# EAGLE design source_eagle (EAGLE 9.6.2)
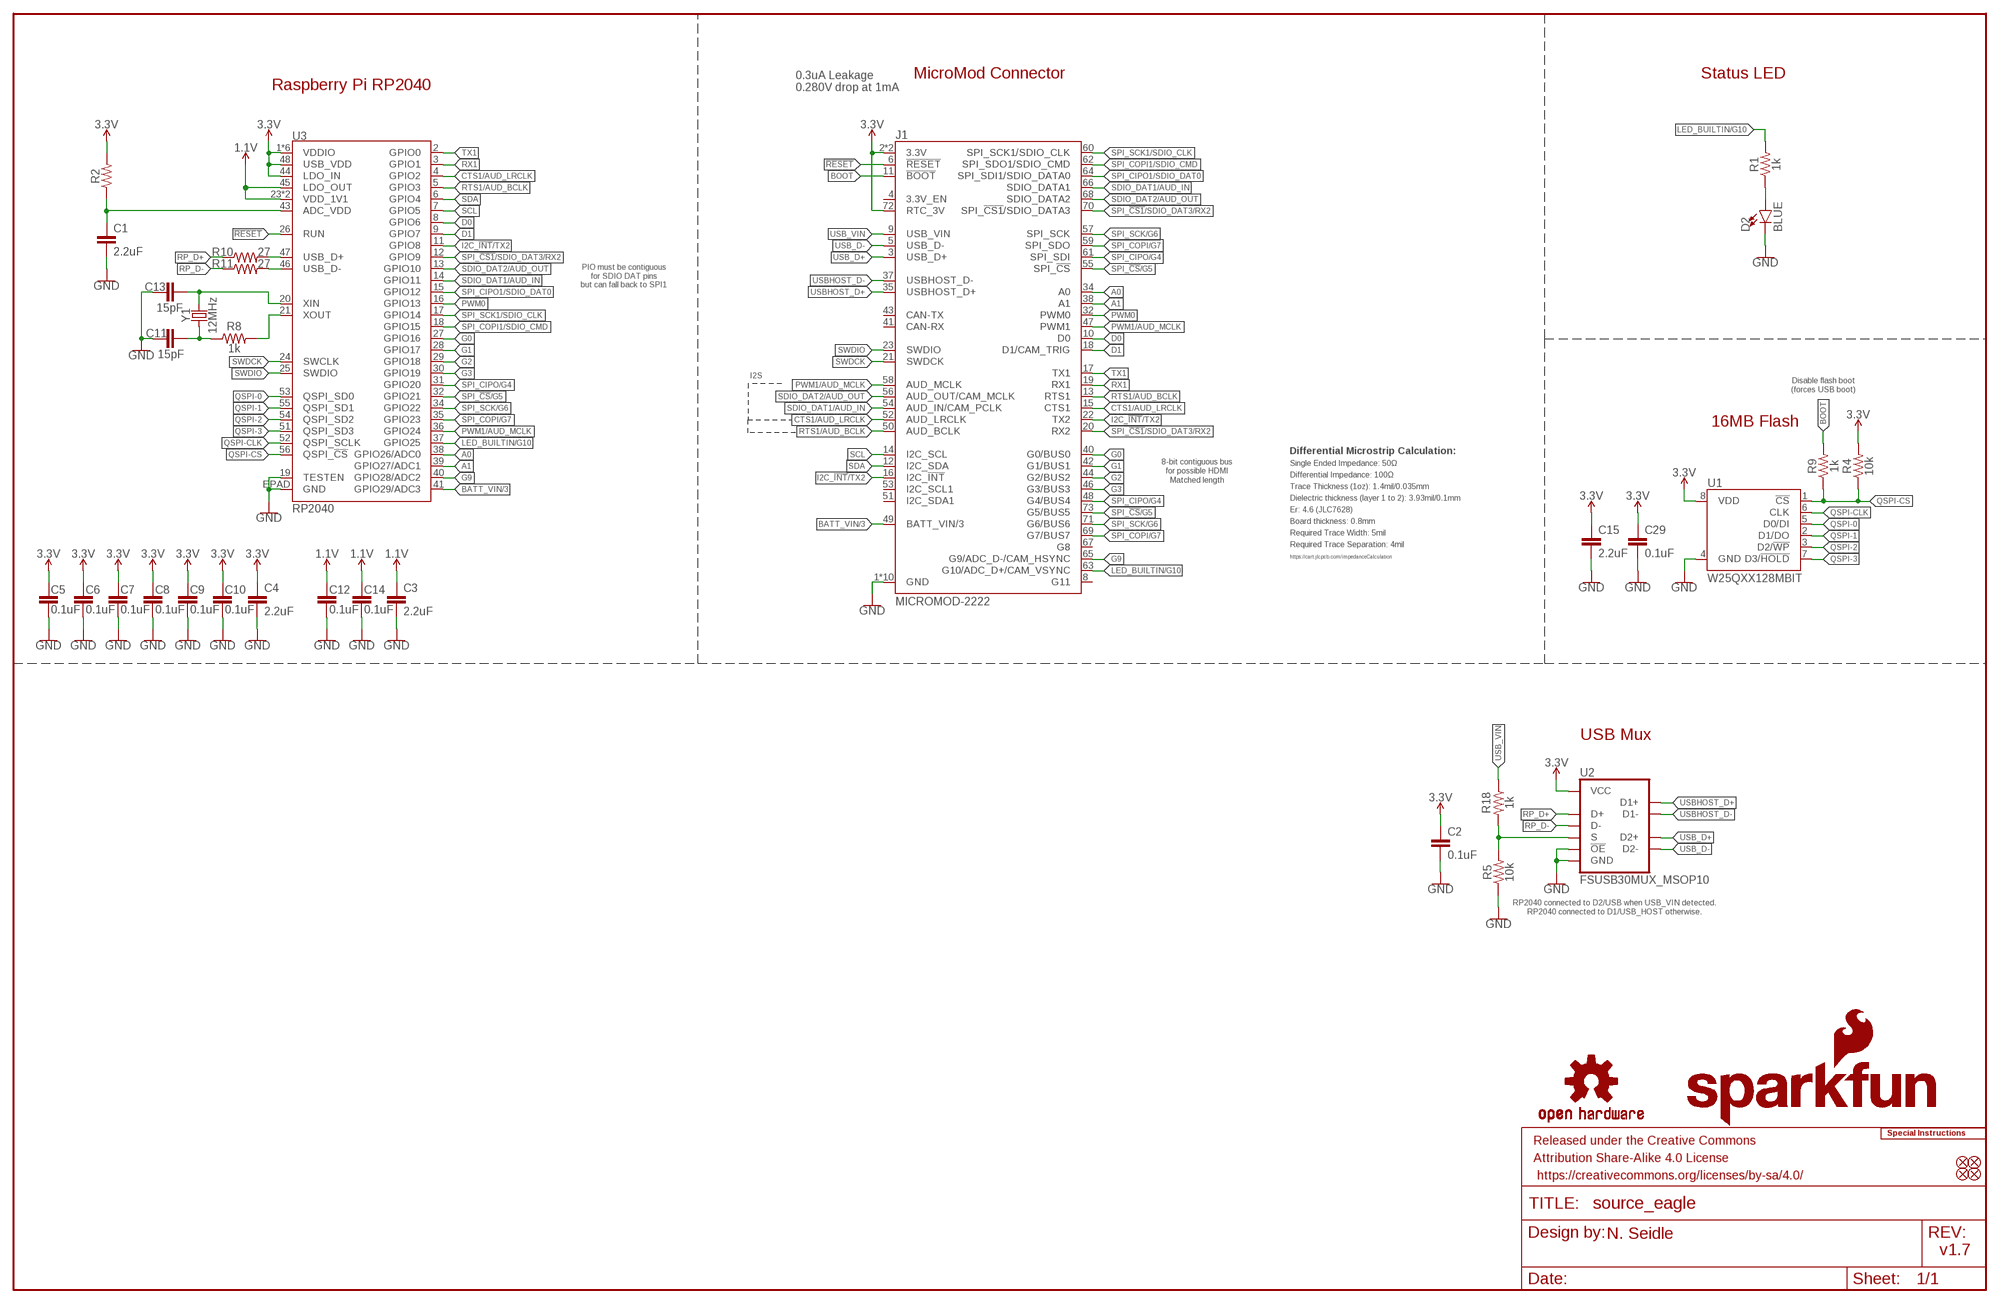
[diagram p0: schematic, sheet 1]

## Parts
C1  2.2uF  2.2UF-0402_TIGHT-10V-10%-X5R  [0402-TIGHT]
C2  0.1uF  0.1UF-0402T-6.3V-10%-X7R  [0402-TIGHT]
C3  2.2uF  2.2UF-0402_TIGHT-10V-10%-X5R  [0402-TIGHT]
C4  2.2uF  2.2UF-0402_TIGHT-10V-10%-X5R  [0402-TIGHT]
C5  0.1uF  0.1UF-0402T-6.3V-10%-X7R  [0402-TIGHT]
C6  0.1uF  0.1UF-0402T-6.3V-10%-X7R  [0402-TIGHT]
C7  0.1uF  0.1UF-0402T-6.3V-10%-X7R  [0402-TIGHT]
C8  0.1uF  0.1UF-0402T-6.3V-10%-X7R  [0402-TIGHT]
C9  0.1uF  0.1UF-0402T-6.3V-10%-X7R  [0402-TIGHT]
C10  0.1uF  0.1UF-0402T-6.3V-10%-X7R  [0402-TIGHT]
C11  15pF  15PF-0402T-50V-5%  [0402-TIGHT]
C12  0.1uF  0.1UF-0402T-6.3V-10%-X7R  [0402-TIGHT]
C13  15pF  15PF-0402T-50V-5%  [0402-TIGHT]
C14  0.1uF  0.1UF-0402T-6.3V-10%-X7R  [0402-TIGHT]
C15  2.2uF  2.2UF-0402_TIGHT-10V-10%-X5R  [0402-TIGHT]
C29  0.1uF  0.1UF-0402T-6.3V-10%-X7R  [0402-TIGHT]
D2  BLUE  LED-BLUE0603  [LED-0603]
FD1  FIDUCIALUFIDUCIAL  [FIDUCIAL-MICRO]
FD2  FIDUCIALUFIDUCIAL  [FIDUCIAL-MICRO]
FD3  FIDUCIALUFIDUCIAL  [FIDUCIAL-MICRO]
FD4  FIDUCIALUFIDUCIAL  [FIDUCIAL-MICRO]
FRAME1  FRAME-LEDGER  [CREATIVE_COMMONS]
J1  MICROMOD-2222  [M.2-CARD-E-22]
LOGO1  SFE_LOGO_NAME_FLAME.1_INCH  [SFE_LOGO_NAME_FLAME_.1]
LOGO2  SFE_LOGO_FLAME.1_INCH  [SFE_LOGO_FLAME_.1]
LOGO3  OSHW-LOGOMINI  [OSHW-LOGO-MINI]
LOGO4  SPECIAL_INSTRUCTIONS-ORDERING  [ORDERING_INSTRUCTIONS]
R1  1k  1KOHM-0402T-1/16W-1%  [0402-TIGHT]
R2  200OHM-0402T-1/16W-1%  [0402-TIGHT]
R4  10k  10KOHM-0402T-1/16W-1%  [0402-TIGHT]
R5  10k  10KOHM-0402T-1/16W-1%  [0402-TIGHT]
R8  1k  1KOHM-0402T-1/16W-1%  [0402-TIGHT]
R9  1k  1KOHM-0402T-1/16W-1%  [0402-TIGHT]
R10  27  27OHM  [0402-TIGHT]
R11  27  27OHM  [0402-TIGHT]
R18  1k  1KOHM-0402T-1/16W-1%  [0402-TIGHT]
U1  W25QXX128MBIT  W25QXX128MBIT-6X5-SKINNY_CENTER  [WSON-8-6X5-SKINNY_CENTERPAD]
U2  FSUSB30MUX_MSOP10  [MSOP10]
U3  RP2040  [QFN-56]
Y1  12MHz  CRYSTAL-12MHZ  [CRYSTAL-SMD-2X2.5MM]

## Nets
1.1V: C3.1 C12.1 C14.1 U3.23(VDD_1V1) U3.45(LDO_OUT) U3.50(VDD_1V1)
3.3V: C2.1 C4.1 C5.1 C6.1 C7.1 C8.1 C9.1 C10.1 C15.1 C29.1 J1.2(3.3V) J1.72(RTC_3V) J1.74(3.3V) R2.2 R4.2 U1.8(VDD) U2.10(VCC) U3.1(VDDIO) U3.10(VDDIO) U3.22(VDDIO) U3.33(VDDIO) U3.42(VDDIO) U3.44(LDO_IN) U3.48(USB_VDD) U3.49(VDDIO)
!RESET!: J1.6(!RESET!) U3.26(RUN)
A0: J1.34(A0) U3.38(GPIO26/ADC0)
A1: J1.38(A1) U3.39(GPIO27/ADC1)
ADC_VDD: C1.1 R2.1 U3.43(ADC_VDD)
BATT_VIN/3: J1.49(BATT_VIN/3) U3.41(GPIO29/ADC3)
BOOT: J1.11(!BOOT!) R9.2
CTS1/AUD_LRCLK: J1.15(CTS1) J1.52(AUD_LRCLK) U3.4(GPIO2)
D0: J1.10(D0) U3.8(GPIO6)
D1: J1.18(D1/CAM_TRIG) U3.9(GPIO7)
G0 [DiffPair]: J1.40(G0/BUS0) U3.27(GPIO16)
G1 [DiffPair]: J1.42(G1/BUS1) U3.28(GPIO17)
G2 [DiffPair]: J1.44(G2/BUS2) U3.29(GPIO18)
G3 [DiffPair]: J1.46(G3/BUS3) U3.30(GPIO19)
G9: J1.65(G9/ADC_D-/CAM_HSYNC) U3.40(GPIO28/ADC2)
GND: C1.2 C2.2 C3.2 C4.2 C5.2 C6.2 C7.2 C8.2 C9.2 C10.2 C11.1 C12.2 C13.1 C14.2 C15.2 C29.2 D2.C J1.1(GND) J1.7(GND) J1.33(GND) J1.36(GND) J1.39(GND) J1.45(GND) J1.75(GND) J1.GND1(GND) J1.GND2(GND) J1.GND3(GND) R5.1 U1.4(GND) U2.5(GND) U2.9(!OE!) U3.19(TESTEN) U3.EPAD(GND)
I2C_!INT!/TX2: J1.16(I2C_!INT!) J1.22(TX2) U3.11(GPIO8)
LED_BUILTIN/G10: J1.63(G10/ADC_D+/CAM_VSYNC) R1.2 U3.37(GPIO25)
N$2: D2.A R1.1
N$4: R8.2 U3.21(XOUT)
N$5: C13.2 U3.20(XIN) Y1.P3
N$6: C11.2 R8.1 Y1.P1
PWM0: J1.32(PWM0) U3.16(GPIO13)
PWM1/AUD_MCLK: J1.47(PWM1) J1.58(AUD_MCLK) U3.36(GPIO24)
QSPI-0: U1.5(D0/DI) U3.53(QSPI_SD0)
QSPI-1: U1.2(D1/DO) U3.55(QSPI_SD1)
QSPI-2: U1.3(D2/!WP!) U3.54(QSPI_SD2)
QSPI-3: U1.7(D3/!HOLD!) U3.51(QSPI_SD3)
QSPI-CLK [Clock]: U1.6(CLK) U3.52(QSPI_SCLK)
QSPI-CS: R4.1 R9.1 U1.1(!CS!) U3.56(QSPI_!CS!)
RP_D1+: R10.2 U3.47(USB_D+)
RP_D1-: R11.2 U3.46(USB_D-)
RP_D+: R10.1 U2.4(D+)
RP_D-: R11.1 U2.6(D-)
RTS1/AUD_BCLK: J1.13(RTS1) J1.50(AUD_BCLK) U3.5(GPIO3)
RX1: J1.19(RX1) U3.3(GPIO1)
SCL: J1.14(I2C_SCL) U3.7(GPIO5)
SDA: J1.12(I2C_SDA) U3.6(GPIO4)
SDIO_DAT1/AUD_IN: J1.54(AUD_IN/CAM_PCLK) J1.66(SDIO_DATA1) U3.14(GPIO11)
SDIO_DAT2/AUD_OUT: J1.56(AUD_OUT/CAM_MCLK) J1.68(SDIO_DATA2) U3.13(GPIO10)
SPI_!CS1!/SDIO_DAT3/RX2: J1.20(RX2) J1.70(SPI_!CS1!/SDIO_DATA3) U3.12(GPIO9)
SPI_!CS!/G5 [DiffPair]: J1.55(SPI_!CS!) J1.73(G5/BUS5) U3.32(GPIO21)
SPI_CIPO1/SDIO_DAT0: J1.64(SPI_SDI1/SDIO_DATA0) U3.15(GPIO12)
SPI_CIPO/G4 [DiffPair]: J1.48(G4/BUS4) J1.61(SPI_SDI) U3.31(GPIO20)
SPI_COPI1/SDIO_CMD: J1.62(SPI_SDO1/SDIO_CMD) U3.18(GPIO15)
SPI_COPI/G7 [DiffPair]: J1.59(SPI_SDO) J1.69(G7/BUS7) U3.35(GPIO23)
SPI_SCK1/SDIO_CLK: J1.60(SPI_SCK1/SDIO_CLK) U3.17(GPIO14)
SPI_SCK/G6 [DiffPair]: J1.57(SPI_SCK) J1.71(G6/BUS6) U3.34(GPIO22)
SWDCK: J1.21(SWDCK) U3.24(SWCLK)
SWDIO: J1.23(SWDIO) U3.25(SWDIO)
TX1: J1.17(TX1) U3.2(GPIO0)
USB_D+: J1.3(USB_D+) U2.3(D2+)
USB_D-: J1.5(USB_D-) U2.7(D2-)
USB_MUX_SIG: R5.2 R18.2 U2.1(S)
USB_VIN: J1.9(USB_VIN) R18.1
USBHOST_D+: J1.35(USBHOST_D+) U2.2(D1+)
USBHOST_D-: J1.37(USBHOST_D-) U2.8(D1-)
Unconnected: J1.4(3.3V_EN) J1.8(G11) J1.41(CAN-RX) J1.43(CAN-TX) J1.51(I2C_SDA1) J1.53(I2C_SCL1) J1.67(G8)

## Notes on the sheet
- MicroMod Connector | Status LED
- Raspberry Pi RP2040
- 0.3uA Leakage
  0.280V drop at 1mA
- PIO must be contiguous
  for SDIO DAT pins
  but can fall back to SPI1
- I2S
- Disable flash boot
  (forces USB boot)
- 16MB Flash
- Differential Microstrip Calculation:
- 8-bit contiguous bus
  for possible HDMI
- Single Ended Impedance: 50Ω
- Differential Impedance: 100Ω
- Matched length
- Trace Thickness (1oz): 1.4mil/0.035mm
- Dielectric thickness (layer 1 to 2): 3.93mil/0.1mm
- Er: 4.6 (JLC7628)
- Board thickness: 0.8mm
- Required Trace Width: 5mil
- Required Trace Separation: 4mil
- https://cart.jlcpcb.com/impedanceCalculation
- USB Mux
- RP2040 connected to D2/USB when USB_VIN detected.
  RP2040 connected to D1/USB_HOST otherwise.
- N. Seidle
- v1.7

## Library data of the parts
C1 C3 C4 C15 = SparkFun-Capacitors:2.2UF: 2.2µF ceramic capacitors A capacitor is a passive two-terminal electrical component used to store electrical energy temporarily in an electric field.; PROD_ID: CAP-14232
C2 C5-C10 C12 C14 C29 = SparkFun-Capacitors:0.1UF: 0.1µF ceramic capacitors A capacitor is a passive two-terminal electrical component used to store electrical energy temporarily in an electric field.; PROD_ID: CAP-14993
C11 C13 = SparkFun-Capacitors:15PF: 15pF ceramic capacitors A capacitor is a passive two-terminal electrical component used to store electrical energy temporarily in an electric field.; PROD_ID: CAP-13063
D2 = SparkFun-LED:LED-BLUE: Blue SMD LED Used in manufacturing of various products at SparkFun Packages: 0603 - SMD 0603 package [Product Link] <http://www.digikey.com/product-detail/en/SMLE12BC7TT86/511-1589-2-ND/1641808> 1206 - SMD1206 package [Product Link] <http://www.digikey.com/product-detail/en/lite-on-inc/LTST-C150TBKT/160-1643-1-ND/573584> SparkFun Products: ESP8266 Thing-Dev Board <https://www.sparkfun.com/products/13711> RedBoard <https://www.sparkfun.com/products/12757>; PROD_ID: DIO-08575
FD1-FD4 = SparkFun-Aesthetics:FIDUCIAL: Fiducial Alignment Points Point-of-reference for pick-and-place machines and other optical instruments.
FRAME1 = SparkFun-Aesthetics:FRAME-LEDGER: Schematic Frame - Ledger Standard 11x14 US Ledger frame
J1 = SparkFun-MicroMod:MICROMOD: MicroMod Connector Description: A card edge connector and mating PCB connector to allow various MicroMod Processor Boards to be coupled with various carrier boards of different capabilities. Based on the M.2 standard.
LOGO1 = SparkFun-Aesthetics:SFE_LOGO_NAME_FLAME: SparkFun Font Logo w/ Flame This is the SparkFun full logo. The logo on the schematic will always be the same size; the package variant is the height of the flame part of the logo. Default layer for the logo on the board is tSilk.
LOGO2 = SparkFun-Aesthetics:SFE_LOGO_FLAME: SparkFun Flame Logo This is the SparkFun flame logo. The logo on the schematic will always be the same size; the package variant is the height of the flame. Default layer for the logo on the board is tSilk.
LOGO3 = SparkFun-Aesthetics:OSHW-LOGO: Open-Source Hardware (OSHW) Logo This logo indicates the piece of hardware it is found on incorporates a OSHW license and/or adheres to the definition of open source hardware found here: http://freedomdefined.org/OSHW
LOGO4 = SparkFun-Aesthetics:SPECIAL_INSTRUCTIONS: Special Ordering/Production Instructions Alert Symbol for special PCB ordering instructions or unique production process warnings. Ordering Instructions Production Instructions Types of information that should be added to box: Copper weight Soldermask color Silk color PCB thickness Number of layers PCB Standard: 1.6mm FR4 1 oz copper immersion silver plating red soldermask white silkscreen Types of information that should be added to box: Special wash requirements Depaneling instructions Humidification Glue curing Default text settings: 0.07 inch 9% ratio 50% line distance
R1 R8 R9 R18 = SparkFun-Resistors:1KOHM: 1kΩ resistor A resistor is a passive two-terminal electrical component that implements electrical resistance as a circuit element. Resistors act to reduce current flow, and, at the same time, act to lower voltage levels within circuits. - Wikipedia; PROD_ID: RES-14342
R2 = SparkFun-Resistors:200OHM: 200Ω resistor A resistor is a passive two-terminal electrical component that implements electrical resistance as a circuit element. Resistors act to reduce current flow, and, at the same time, act to lower voltage levels within circuits. - Wikipedia; PROD_ID: RES-15550
R4 R5 = SparkFun-Resistors:10KOHM: 10kΩ resistor A resistor is a passive two-terminal electrical component that implements electrical resistance as a circuit element. Resistors act to reduce current flow, and, at the same time, act to lower voltage levels within circuits. - Wikipedia; PROD_ID: RES-14241
R10 R11 = SparkFun-Resistors:27OHM: 27Ω resistor A resistor is a passive two-terminal electrical component that implements electrical resistance as a circuit element. Resistors act to reduce current flow, and, at the same time, act to lower voltage levels within circuits. - Wikipedia; PROD_ID: RES-15238
U1 = SparkFun-IC-Memory:W25QXX; PROD_ID: IC-15107
U2 = SparkFun-IC-Special-Function:FSUSB30MUX; PROD_ID: IC-15569
U3 = RP2040:RP2040: Raspberry Pi RP2040 MCU 56-pin 32-bit Microcontroller with 264kB of SRAM and external flash support up to 16MB Getting Started with the RP2040 Dual-core ARM Cortex M0+ processor, flexible clock running up to 133 MHz 264kB of SRAM, and QSPI control of common flash memory USB 1.1 Host and Device support Low-power sleep and dormant modes Drag & drop programming using mass storage over USB 26 multi-function GPIO pins 2×SPI, 2×I2C, 2×UART, 3×12-bit ADC, 16×controllable PWM channels Accurate clock and timer on-chip Temperature sensor Accelerated floating point libraries on-chip 8×Programmable IO (PIO) state machines for custom peripheral support; PROD_ID: IC-15502
Y1 = SparkFun-Clocks:CRYSTAL-12MHZ: 12.0MHz Crystal Frequency: 12.0MHz Frequency Tolerance: ±20ppm Load Capacitance: 18pF SparkFun Products: SparkFun Logomatic <https://www.sparkfun.com/products/12772> Pocket AVR Programmer <https://www.sparkfun.com/products/9825>; PROD_ID: XTAL-15540

## Net classes
1 DiffPair: width 0.127 mm, clearance 0.178 mm
2 Clock: width 0.089 mm, clearance 0.178 mm
4 InternalPower: width 0.152 mm

## Board
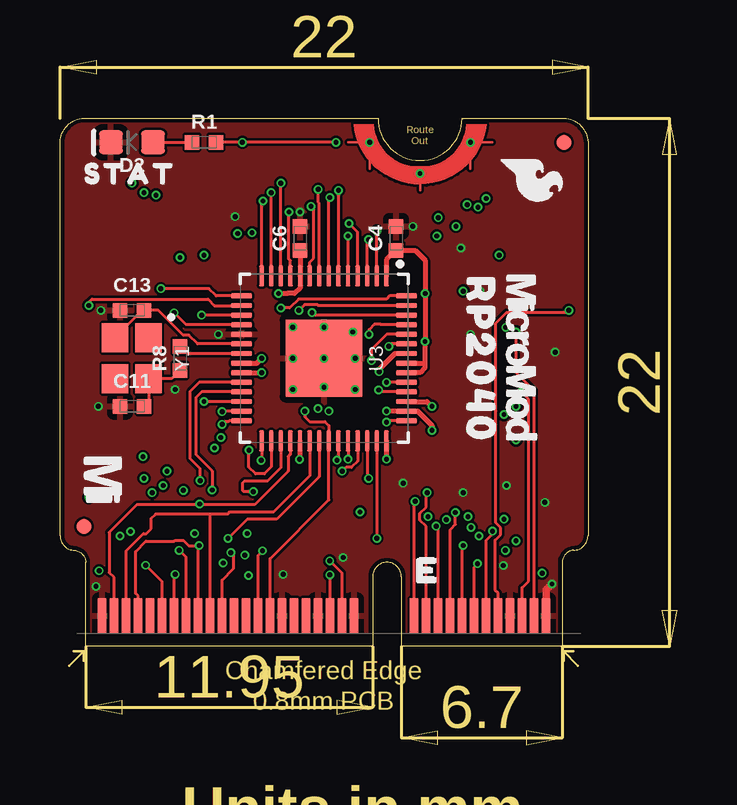
[diagram p1: board, top side]
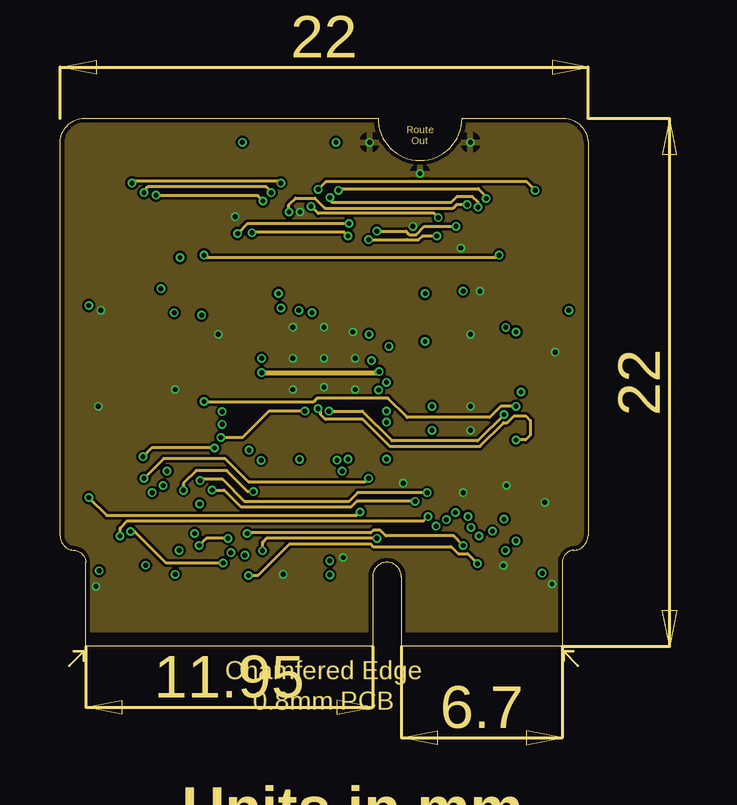
[diagram p2: board, inner layer Horz]
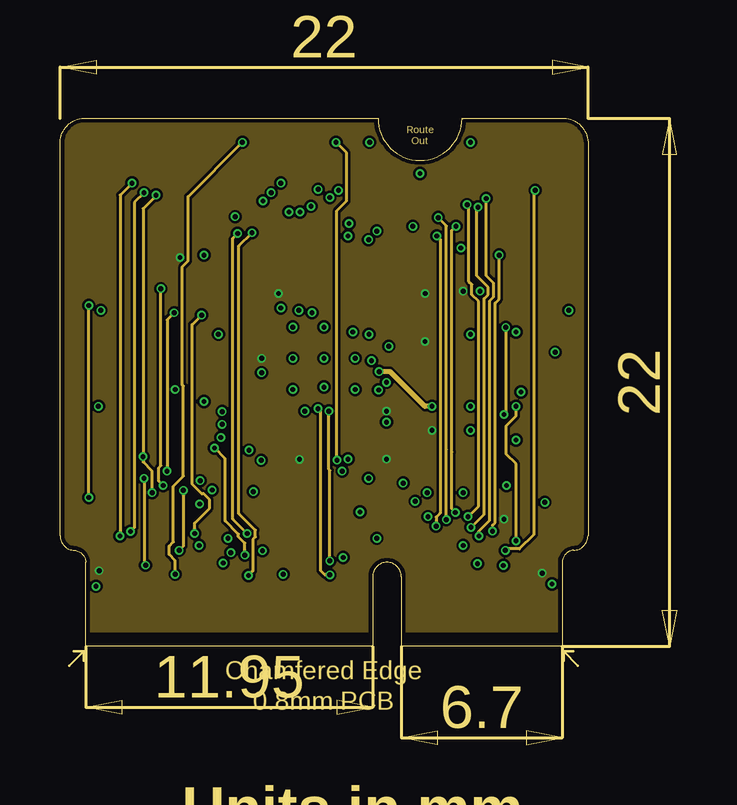
[diagram p3: board, inner layer Vert]
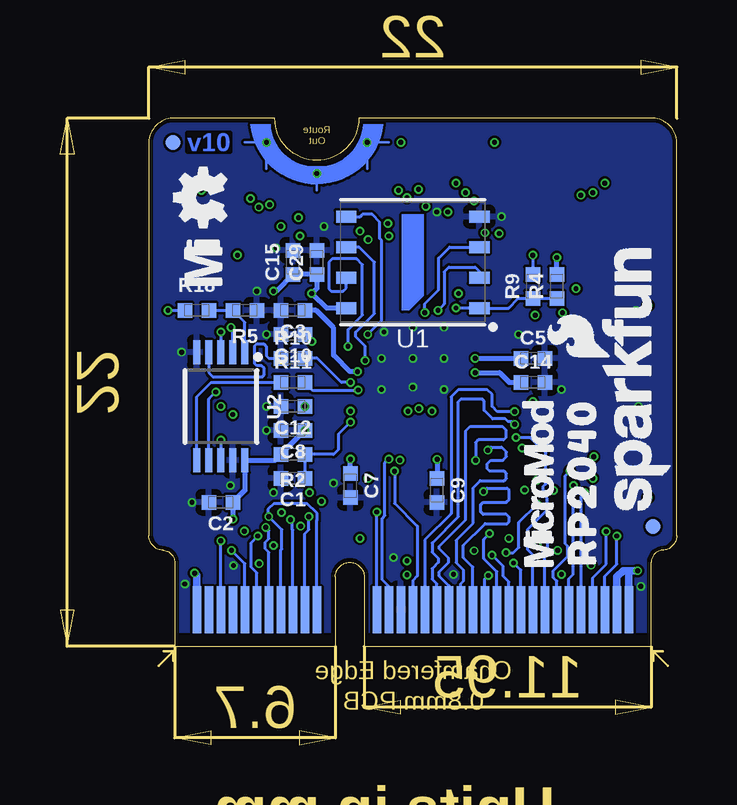
[diagram p4: board, bottom side, seen from below]

Size 25.7 x 28.54 mm. Coordinates in mm from the lower left corner, seen from the top.
Outline: 0,8.71 0,25.11 arc-87 1,26.11 13.25,26.11 arc180 16.75,26.11 21,26.11 arc-87 22,25.11 22,8.71
Outline: 0,8.71 arc87 0.6,8.11
Outline: 21.4,8.11 arc87 22,8.71
Outline: 21.4,8.11 arc85 20.93,7.61 20.93,4.11 14.22,4.11 14.22,7.01 arc180 13.03,7.01 13.03,4.11 1.07,4.11 1.07,7.61 arc84 0.6,8.11
Outline: 21.4,8.11 arc87 22,8.71
Outline: 0,8.71 arc87 0.6,8.11
Copper layers (1+2*15+16): Top 0.035mm / dielectric 1.5mm / Horz 0.035mm / dielectric 0.15mm / Vert 0.035mm / dielectric 0.2mm / Bottom 0.035mm
Design rules "SparkFun-4-layer-MicroMod": minimum track width 4mil, minimum drill 0.2mm, track to track 4mil, track to pad 4mil, pad to pad 4mil, via to via 4mil, smd to smd 4mil, copper to edge 6mil, drill to drill 6mil, minimum pad ring 3mil, minimum via ring 3mil, stop-mask expansion 4mil, vias tented up to drill 25mil, thermal gap 10mil

### Footprints (pad centres in the part's own frame; a part is rotated, then mirrored left to right if it is on the bottom)
0402-TIGHT = smd 0.6 x 0.6: 1 -0.5,0; 2 0.5,0
LED-0603 = smd 1 x 1: A -0.877,0; C 0.877,0
FIDUCIAL-MICRO = smd 0.635 x 0.635: 1 0,0
M.2-CARD-E-22 = smd 0.35 x 1.45: 1 9.25,1.275; 3 8.75,1.275; 5 8.25,1.275; 7 7.75,1.275; 9 7.25,1.275; 11 6.75,1.275; 13 6.25,1.275; 15 5.75,1.275; 17 5.25,1.275; 19 4.75,1.275; 21 4.25,1.275; 23 3.75,1.275; 33 1.25,1.275; 35 0.75,1.275; 37 0.25,1.275; 39 -0.25,1.275; 41 -0.75,1.275; 43 -1.25,1.275; 45 -1.75,1.275; 47 -2.25,1.275; 49 -2.75,1.275; 51 -3.25,1.275; 53 -3.75,1.275; 55 -4.25,1.275; 57 -4.75,1.275; 59 -5.25,1.275; 61 -5.75,1.275; 63 -6.25,1.275; 65 -6.75,1.275; 67 -7.25,1.275; 69 -7.75,1.275; 71 -8.25,1.275; 73 -8.75,1.275; 75 -9.25,1.275 | smd 0.35 x 1.95 bottom: 2 9,1.525; 4 8.5,1.525; 6 8,1.525; 8 7.5,1.525; 10 7,1.525; 12 6.5,1.525; 14 6,1.525; 16 5.5,1.525; 18 5,1.525; 20 4.5,1.525; 22 4,1.525; 32 1.5,1.525; 34 1,1.525; 36 0.5,1.525; 38 0,1.525; 40 -0.5,1.525; 42 -1,1.525; 44 -1.5,1.525; 46 -2,1.525; 48 -2.5,1.525; 50 -3,1.525; 52 -3.5,1.525; 54 -4,1.525; 56 -4.5,1.525; 58 -5,1.525; 60 -5.5,1.525; 62 -6,1.525; 64 -6.5,1.525; 66 -7,1.525; 68 -7.5,1.525; 70 -8,1.525; 72 -8.5,1.525; 74 -9,1.525 | drill 0.2: GND1 1.9,21; GND2 4,19.7; GND3 6.1,21
WSON-8-6X5-SKINNY_CENTERPAD = smd 0.85 x 0.5: 1 -2.775,1.905; 2 -2.775,0.635; 3 -2.775,-0.635; 4 -2.775,-1.905; 5 2.775,-1.905; 6 2.775,-0.635; 7 2.775,0.635; 8 2.775,1.905
MSOP10 = smd 1 x 0.3: 1 -2.25,1; 2 -2.25,0.5; 3 -2.25,0; 4 -2.25,-0.5; 5 -2.25,-1; 6 2.25,-1; 7 2.25,-0.5; 8 2.25,0; 9 2.25,0.5; 10 2.25,1
QFN-56 = smd 0.875 x 0.2: 1 -3.437,2.6; 2 -3.437,2.2; 3 -3.437,1.8; 4 -3.437,1.4; 5 -3.437,1; 6 -3.437,0.6; 7 -3.437,0.2; 8 -3.437,-0.2; 9 -3.437,-0.6; 10 -3.437,-1; 11 -3.437,-1.4; 12 -3.437,-1.8; 13 -3.437,-2.2; 14 -3.437,-2.6; 29 3.437,-2.6; 30 3.437,-2.2; 31 3.437,-1.8; 32 3.437,-1.4; 33 3.437,-1; 34 3.437,-0.6; 35 3.437,-0.2; 36 3.437,0.2; 37 3.437,0.6; 38 3.437,1; 39 3.437,1.4; 40 3.437,1.8; 41 3.437,2.2; 42 3.437,2.6 | smd 0.2 x 0.875: 15 -2.6,-3.437; 16 -2.2,-3.437; 17 -1.8,-3.437; 18 -1.4,-3.437; 19 -1,-3.437; 20 -0.6,-3.437; 21 -0.2,-3.437; 22 0.2,-3.437; 23 0.6,-3.437; 24 1,-3.437; 25 1.4,-3.437; 26 1.8,-3.437; 27 2.2,-3.437; 28 2.6,-3.437; 43 2.6,3.437; 44 2.2,3.437; 45 1.8,3.437; 46 1.4,3.437; 47 1,3.437; 48 0.6,3.437; 49 0.2,3.437; 50 -0.2,3.437; 51 -0.6,3.437; 52 -1,3.437; 53 -1.4,3.437; 54 -1.8,3.437; 55 -2.2,3.437; 56 -2.6,3.437 | smd 3.2 x 3.2: EPAD 0,0
CRYSTAL-SMD-2X2.5MM = smd 1.2 x 1.1: P1 0.846,0.69; P2 -0.854,0.69; P3 -0.854,-0.71; P4 0.846,-0.71

### Placement (x,y rotation side)
C1  16,11.11 180 bottom
C2  19,10.11 180 bottom
C3  16,18.11 180 bottom
C4  14,21.11 90 top
C5  6,16.11 0 bottom
C6  10,21.11 90 top
C7  13.6,10.81 270 bottom
C8  16,13.11 180 bottom
C9  10,10.61 270 bottom
C10  16,17.11 180 bottom
C11  3,14.11 0 top
C12  16,14.11 180 bottom
C13  3,18.11 0 top
C14  6,15.11 0 bottom
C15  16,20.11 90 bottom
C29  15,20.11 90 bottom
D2  3,25.11 180 top
FD1  1,9.11 0 top
FD2  21,25.11 0 top
FD3  21,25.11 0 bottom
FD4  1,9.11 0 bottom
FRAME1  not placed on the board
J1  11,4.11 0 top
LOGO1  1.7,15.31 90 bottom
LOGO2  19.68,23.54 270 top
LOGO3  19.75,22.81 90 bottom
LOGO4  not placed on the board
R1  6,25.11 0 top
R2  16,12.11 180 bottom
R4  5,19.11 90 bottom
R5  18,18.11 180 bottom
R8  5,16.11 90 top
R9  6,19.11 90 bottom
R10  16,16.11 0 bottom
R11  16,15.11 0 bottom
R18  20,18.11 0 bottom
U1  11,20.11 180 bottom
U2  19,14.11 270 bottom
U3  11,16.11 270 top
U$1  [MICROMOD_MI_LOGO_.35]  1.81,11.08 270 top
U$3  [MICROMOD_LOGO_.3]  5.71,10.84 90 bottom
U$4  [RP20400]  3.94,10.97 90 bottom
U$7  [MICROMOD_MI_LOGO_.35]  19.75,20.07 90 bottom
U$9  [RP20400]  17.53,16.05 270 top
U$11  [STAT0]  0.38,23.79 0 top
U$12  [MICROMOD_LOGO_.3]  19.18,16.18 270 top
Y1  3,16.11 270 top

### Tracks (layer width: path | path; a pad name or v marks a point on that pad's centre or on a via)
1.1V  (via drill 0.2)
  Top 0.203: U3.45 15.3,14.31 C12.1 | U3.50 13.95,16.31 13.3,15.66 v13.3,15.56 | U3.23 v8.4,15.51
  Horz 0.127: v13.3,15.56 13.3,15.51
  Horz 0.203: v8.4,15.51 13.3,15.51
  Vert 0.203: C12.1 15.2,14.11 13.75,15.56 v13.3,15.56
  Bottom 0.203: v8.4,15.51 7.38,15.51 6.98,15.11 C14.1 | v13.3,15.56 13.62,15.56 14.3,16.23 14.3,17.38 15.03,18.11 C3.1
  other vias: 15.5,14.11
3.3V  (via drill 0.2)
  Top 0.127: v15.21,16.81 v15.21,16.82
  Top 0.203: U3.42 v13.6,11.91 | v13.6,13.91 U3.44 14.9,13.91 15.5,13.31 C8.1 | U3.48 15,15.51 15.21,15.72 15.21,15.91 | v9.98,11.9 10,11.92 U3.33 | C6.1 U3.10 10,19.04 9.77,18.81 9.48,18.81 v9.1,18.81 | U3.1 13.6,20.21 C4.1 14.8,20.61 15.21,20.2 v15.21,18.81 v15.21,16.82 | v15.21,16.81 15.21,15.91 | U3.49 15.21,15.91 | U3.22 8.2,15.91 v8.4,16.11
  Bottom 0.127: v15.21,16.82 v15.21,16.81 | C9.1 9.98,11.13 | 15.18,18.81 v15.21,18.81
  Bottom 0.203: C10.1 v15.21,16.82 | v9.98,11.9 9.98,11.13 | R4.2 v5,20.31 | v18.5,9.41 C2.1 18,10.61 U2.10 16.75,11.86 R2.2 C8.1 | C7.1 v13.6,11.91 | v16.8,18.91 16.7,18.91 C15.1 C29.1 15,19.02 v15.21,18.81 | 15.18,18.81 14.57,18.21 U1.8 | v8.4,16.11 C5.1
  Bottom 0.305: J1.72 2.5,7 2.24,7.26 v1.63,7.26 1.93,7.26 2,7.19 J1.74 | J1.2 20,7.07 v20.09,7.16
  other vias: 15.5,13.11
  pour Vert (isolate 0.102): 0,26.11 22,26.11 22,4.75 0,4.75
!RESET!  (via drill 0.2)
  Top 0.127: U3.26 v6,14.31
  Horz 0.127: v6,14.31 10.56,14.31 10.71,14.45 13.66,14.45 14.46,13.65 17.9,13.65 18.36,14.11 v19,14.11
  Vert 0.127: v19,8.51 19,11.71 18.6,12.11 18.6,13.31 19,13.71 v19,14.11
  Bottom 0.127: J1.6 v19,8.51
A0  (via drill 0.2)
  Top 0.127: U3.38 v12,11.91
  Bottom 0.127: J1.34 12,6.61 12.27,6.88 12.27,9.46 12.16,9.57 12.16,11.75 v12,11.91
A1  (via drill 0.2)
  Top 0.127: v11.76,11.41 11.92,11.57 12.14,11.57 12.4,11.83 U3.39
  Bottom 0.127: v11.76,11.41 11.76,10.07 10.8,9.12 10.8,7.04 11,6.85 J1.38
ADC_VDD  (via drill 0.2)
  Top 0.127: U3.43 13.66,13.51 v13.6,13.45
  Bottom 0.127: v13.6,13.45 14.1,12.95 14.1,12.31 14.3,12.11 R2.1 C1.1
BATT_VIN/3  (via drill 0.2)
  Top 0.127: U3.41 v13.2,8.61 | v8.44,8.09 8.25,7.9 J1.49
  Horz 0.127: v13.2,8.61 8.6,8.61 8.44,8.45 v8.44,8.09
BOOT  (via drill 0.2)
  Top 0.127: J1.11 17.75,8.52 18.02,8.79 v18.02,8.91
  Horz 0.127: v18.3,20.41 18.2,20.31 6.1,20.31 v6,20.41
  Vert 0.127: v18.02,8.91 18.02,9.16 18.13,9.26 18.13,18.41 18.3,18.58 v18.3,20.41
  Bottom 0.127: v6,20.41 R9.2
CTS1/AUD_LRCLK  (via drill 0.2)
  Top 0.127: U3.4 12.4,21.37 v12.04,21.73 | J1.15 16.75,8.26 v16.8,8.31
  Horz 0.127: v12.04,21.73 7.82,21.73 v7.4,21.31 | v16.8,8.31 16.4,8.71 13.58,8.71 13.34,8.95 13.06,8.95 12.95,8.84 7.83,8.84 v7.8,8.81
  Vert 0.127: v7.4,21.31 7.2,21.11 7.2,9.41 v7.8,8.81
  Bottom 0.127: J1.52 7.5,7.23 8.04,7.77 8.04,8.57 v7.8,8.81
D0  (via drill 0.2)
  Top 0.127: U3.8 10.8,22.58 10.76,22.62 v10.76,23.15
  Horz 0.127: v10.76,23.15 11.08,23.47 19.44,23.47 v19.8,23.11
  Vert 0.127: v18.56,8.11 18.61,8.17 19.14,8.17 19.75,8.77 19.75,23.06 v19.8,23.11
  Bottom 0.127: J1.10 18,7.55 v18.56,8.11
D1  (via drill 0.2)
  Top 0.127: U3.9 10.4,20.11 10.57,20.28 10.57,22.33 v10.46,22.44
  Horz 0.127: v10.46,22.44 10.76,22.14 15.59,22.14 v15.76,21.97
  Vert 0.127: v16.09,9.39 16.09,12.3 16.1,12.31 16.1,21.63 v15.76,21.97
  Bottom 0.127: v16.09,9.39 16.01,9.31 16.01,8.97 16,8.96 J1.18
G0  (via drill 0.2)
  Top 0.127: U3.27 6.78,13.91 v6.76,13.89
  Bottom 0.127: J1.40 10.5,8.54 9.4,9.64 9.4,14.5 9.11,14.8 7.9,14.8 7.7,14.61 7.7,14.11 7.48,13.89 v6.76,13.89
G1  (via drill 0.2)
  Top 0.127: U3.28 7.07,13.51 7.03,13.47 6.87,13.47 v6.76,13.36
  Bottom 0.127: v6.76,13.36 6.87,13.47 7.03,13.47 7.14,13.58 7.67,13.58 8.03,13.94 8.03,14.34 8.1,14.41 9,14.41 9.1,14.31 9.1,9.51 10.2,8.41 10.2,8.04 9.93,7.78 9.93,7.61 10.2,7.35 10.2,6.91 10,6.71 J1.42
G2  (via drill 0.2)
  Top 0.127: v8.38,11.86 8.4,11.88 U3.29
  Bottom 0.127: J1.44 9.5,6.64 9.89,7.03 9.89,7.22 9.51,7.61 9.51,7.78 9.89,8.17 9.89,8.29 8.79,9.38 8.79,13.08 8.6,13.28 7.27,13.28 7.12,13.13 7.12,12.81 7.22,12.71 8.27,12.71 8.38,12.59 v8.38,11.86
G3  (via drill 0.2)
  Top 0.127: v7.87,12.28 7.87,11.58 8.15,11.3 8.51,11.3 8.8,11.59 U3.30
  Bottom 0.127: J1.46 9,6.72 8.88,6.84 8.88,7.28 9.2,7.6 9.2,8.53 8.48,9.24 8.48,10.72 8.19,11.01 7.2,11.01 7.1,11.11 7.1,11.31 7.2,11.41 7.8,11.41 7.9,11.51 7.9,11.71 7.75,11.86 7.25,11.86 7.1,12.01 7.1,12.21 7.29,12.41 7.75,12.41 v7.87,12.28
G9  (via drill 0.2)
  Top 0.127: U3.40 12.8,11.17 v12.86,11.11 | J1.65 4.25,6.81 v3.57,7.49
  Horz 0.127: v3.5,11.11 4.32,11.93 6.88,11.93 7.83,10.97 12.72,10.97 v12.86,11.11
  Vert 0.127: v3.5,11.11 3.5,7.56 v3.57,7.49
GND  (via drill 0.2)
  Top 0.305: J1.1 20.25,6.46 v20.5,6.71
  other vias: 18.47,7.48 16.8,10.51 17.1,13.11 18.6,10.81 17.1,14.11 20.63,16.37 16.7,20.71 14.7,21.61 7.3,22.01 6.6,17.11 14.3,10.91 9.7,17.41 12.2,17.21 12.3,14.81 9.7,14.81 11,16.11 1.6,14.11 1.7,18.11 4.8,14.81 17.5,18.91 17.1,17.11 11.8,7.81 9.3,7.11 1.5,6.61 10,22.21 9.7,16.11 12.3,16.11 11,14.91 11,17.41 20.2,10.11
  pour Top (isolate 0.102): 0,26.11 22,26.11 22,4.71 0,4.71
  pour Bottom (isolate 0.102): 0,26.11 22,26.11 22,4.71 0,4.71
  pour Horz (isolate 0.102): 0,4.75 0,26.11 22,26.11 22,4.75
I2C_!INT!/TX2  (via drill 0.2)
  Top 0.127: U3.11 9.6,20.18 9.54,20.24 v9.54,22.2 v9.54,22.21
  Horz 0.127: v9.54,22.21 9.54,22.51 9.82,22.79 10.62,22.79 11.04,22.37 16.38,22.37 16.52,22.51 v16.96,22.51
  Vert 0.127: v17,9.51 17.44,9.95 17.44,18.49 17.16,18.77 17.16,19.19 17.04,19.3 17.04,22.43 v16.96,22.51
  Bottom 0.127: J1.16 16.5,8.13 16.46,8.17 16.46,8.97 v17,9.51 17.04,9.55 17.04,9.81 16.79,10.06 15.4,10.06 14.99,9.65 14.99,9.37 15,9.36 J1.22
LED_BUILTIN/G10  (via drill 0.2)
  Top 0.127: U3.37 11.6,11.92 v11.54,11.86 | v11.5,25.11 v7.6,25.11 R1.2 | J1.63 4.75,7.06 v4.8,7.11
  Vert 0.127: v11.54,11.86 11.54,22.27 11.94,22.67 11.94,24.67 v11.5,25.11 | v4.8,7.11 4.8,7.69 4.55,7.94 4.55,8.28 4.72,8.46 4.72,10.78 5.14,11.2 5.14,14.95 5.1,14.99 5.1,19.93 5.34,20.17 5.34,22.85 v7.6,25.11
N$2
  Top 0.127: D2.A R1.1
N$4
  Top 0.127: U3.21 5.3,16.31 R8.2
N$5
  Top 0.127: Y1.P3 3.44,18.11 C13.2 4.1,18.11 5.13,17.07 5.37,17.07 5.73,16.71 U3.20
N$6
  Top 0.127: R8.1 4.65,15.26 Y1.P1 3.69,14.3 C11.2
PWM0  (via drill 0.2)
  Top 0.127: U3.16 6.43,18.31 6.17,18.57 1.33,18.57 1.2,18.44 v1.2,18.31
  Horz 0.127: v1.2,10.31 1.95,9.56 12.35,9.56 v12.5,9.71
  Vert 0.127: v1.2,10.31 v1.2,18.31
  Bottom 0.127: J1.32 v12.5,9.71
PWM1/AUD_MCLK  (via drill 0.2)
  Top 0.127: J1.47 8.75,7.77 11.2,10.22 U3.36 11.2,13.31 11.04,13.47 10.4,13.47 10.2,13.67 v10.2,13.91
  Horz 0.127: v10.2,13.91 8.7,13.91 7.6,12.81 v6.7,12.81
  Bottom 0.127: v6.7,12.81 6.1,12.81 5.46,12.17 5.46,10.88 5.56,10.78 5.56,10.44 5.4,10.28 5.4,9.8 6.22,8.98 6.22,8.14 6,7.92 J1.58
QSPI-0  (via drill 0.2)
  Top 0.127: U3.53 13.37,17.51 13.36,17.53 13.1,17.53 12.88,17.31 v12.88,17.11
  Bottom 0.127: U1.5 13.2,22.02 13.1,22.11 12.7,22.11 12.38,21.79 12.38,21.11 12.3,21.03 12.3,17.69 v12.88,17.11
QSPI-1  (via drill 0.2)
  Top 0.127: U3.55 10.76,18.31 10.72,18.35 10.2,18.35 v9.95,18.11
  Bottom 0.127: U1.2 8.22,19.73 8.4,19.91 9.5,19.91 9.7,19.71 9.7,18.36 v9.95,18.11
QSPI-2  (via drill 0.2)
  Top 0.127: U3.54 10.6,17.91 v10.5,18.01
  Bottom 0.127: v10.5,18.01 10.5,18.39 9.93,18.96 9.93,20.28 9.46,20.75 U1.3
QSPI-3  (via drill 0.2)
  Top 0.127: U3.51 13.8,16.71 v13.7,16.61
  Bottom 0.127: v13.7,16.61 13.7,17.31 13.1,17.91 13.1,20.01 13.34,20.25 14.36,20.25 14.5,20.11 14.5,19.01 14.4,18.91 13.9,18.91 13.78,19.04 U1.7
QSPI-CLK  (via drill 0.2)
  Top 0.127: U3.52 13.61,17.11 12.98,16.48 v12.98,16.01
  Bottom 0.127: v12.98,16.01 12.98,16.61 13.38,17.01 13.38,17.2 12.61,17.97 12.61,20.11 13.23,20.75 U1.6
QSPI-CS  (via drill 0.2)
  Top 0.127: v9.2,18.21 9.57,18.21 9.94,18.58 13.61,18.58 13.74,18.71 U3.56
  Bottom 0.127: R4.1 R9.1 6.6,18.61 7,18.21 U1.1 v9.2,18.21
RP_D1+  (via drill 0.2)
  Top 0.127: U3.47 v13.6,15.11
  Bottom 0.127: v13.6,15.11 13.98,15.11 14.98,16.11 R10.2
RP_D1-  (via drill 0.2)
  Top 0.127: U3.46 13.36,14.71 v13.28,14.79
  Bottom 0.127: v13.28,14.79 13.44,14.79 13.46,14.77 15.16,14.77 R11.2
RP_D+
  Bottom 0.127: U2.4 19.5,15.51 19.33,15.34 17.27,15.34 17.2,15.41 17.2,15.71 17.3,15.81 17.5,15.81 17.6,15.91 17.6,16.61 17.5,16.71 17.2,16.71 17.1,16.61 17.1,16.21 17,16.11 R10.1
RP_D-
  Bottom 0.127: U2.6 20,14.51 19.4,15.11 R11.1
RTS1/AUD_BCLK  (via drill 0.2)
  Top 0.127: U3.5 v12,21.21 | J1.13 17.25,7.4 v17.4,7.55
  Horz 0.127: v12,21.21 11.84,21.37 8.03,21.37 v8,21.34 | v17.4,7.55 16.98,7.97 16.6,7.97 16.3,8.27 13.06,8.27 12.95,8.38 9.57,8.38 8.26,7.07 v7.86,7.07
  Vert 0.127: v7.86,7.07 8.04,7.25 8.04,8.57 8.14,8.67 8.14,8.95 7.45,9.64 7.45,20.8 v8,21.34
  Bottom 0.127: J1.50 8,6.92 v7.86,7.07
RX1  (via drill 0.2)
  Top 0.127: U3.3 12.8,20.99 v12.86,21.05 | J1.19 15.75,9.04 v15.67,9.12
  Horz 0.127: v15.7,21.21 15.11,21.21 14.94,21.04 14.46,21.04 14.45,21.05 v12.86,21.05
  Vert 0.127: v15.7,21.21 15.84,21.07 15.84,9.66 15.67,9.5 v15.67,9.12
SCL  (via drill 0.2)
  Top 0.127: v11.24,22.81 11.2,22.77 U3.7
  Horz 0.127: v17.42,22.41 17.42,22.62 17.18,22.85 16.54,22.85 16.29,22.6 11.35,22.6 11.24,22.71 v11.24,22.81
  Vert 0.127: v17.13,9.07 17.67,9.61 17.67,18.6 17.84,18.77 17.84,19.07 17.37,19.54 17.37,22.36 v17.42,22.41
  Bottom 0.127: v17.13,9.07 17,8.94 17,8.59 17.14,8.45 17.14,8.17 17,8.03 J1.14
SDA  (via drill 0.2)
  Top 0.127: v11.6,23.11 U3.6
  Horz 0.127: v17.76,22.77 17.76,22.85 17.43,23.18 11.67,23.18 v11.6,23.11
  Vert 0.127: v17.45,8.71 17.45,8.91 17.9,9.36 17.9,18.5 18.07,18.67 18.07,19.24 17.76,19.55 v17.76,22.77
  Bottom 0.127: J1.12 17.5,7.17 17.74,7.41 17.74,8.42 v17.45,8.71
SDIO_DAT1/AUD_IN  (via drill 0.2)
  Top 0.127: U3.14 8.4,22.61 v8.46,22.67
  Horz 0.127: v8.46,22.67 8.24,22.88 4.03,22.88 v4,22.91 | v6.44,12.37 3.82,12.37 v3.46,12.01
  Vert 0.127: v4,22.91 4,22.89 3.46,22.35 v3.46,12.01 3.46,11.79 3.84,11.41 v3.84,10.51 | v7.7,7.91 7.7,8.41 7.43,8.68 7.43,8.79 6.88,9.34 6.88,11.93 v6.44,12.37
  Bottom 0.127: J1.54 7,6.8 7.24,7.04 7.24,7.45 v7.7,7.91 | v3.84,10.51 4,10.35 J1.66
SDIO_DAT2/AUD_OUT  (via drill 0.2)
  Top 0.127: U3.13 v8.8,23.01
  Horz 0.127: v3.5,23.01 3.5,23.09 3.66,23.25 8.6,23.25 8.8,23.05 v8.8,23.01 | v2.94,8.89 3.12,8.89 4.43,7.58 v6.8,7.58
  Vert 0.127: v3.5,23.01 3.1,22.61 3.1,9.05 v2.94,8.89
  Bottom 0.127: J1.68 3.5,6.97 2.94,7.53 v2.94,8.89 | J1.56 6.5,7.28 v6.8,7.58
SPI_!CS1!/SDIO_DAT3/RX2  (via drill 0.2)
  Top 0.127: U3.12 v9.2,23.41
  Horz 0.127: v9.2,23.41 9.16,23.41 9.09,23.48 3.06,23.48 v3,23.42 v3,23.41 | v15.33,9.51 15.15,9.33 2.8,9.33 2.5,9.03 v2.5,8.71
  Vert 0.127: v3,23.41 2.5,22.91 v2.5,8.71
  Bottom 0.127: J1.70 3,7.04 2.5,7.54 v2.5,8.71 | J1.20 15.5,8.8 15.33,8.97 v15.33,9.51
SPI_!CS!/G5  (via drill 0.2)
  Top 0.127: J1.73 2.25,6.99 2.05,7.19 2.05,8.86 3.2,10.01 5.82,10.01 v5.82,10.04 5.84,10.02 8.11,10.02 9.51,11.41 9.51,12.02 9.6,12.11 U3.32 | J1.55 6.75,6.87 7.22,7.34 7.22,7.91 v7.12,8.01
  Bottom 0.127: v5.82,10.04 6.58,9.27 6.58,8.24 6.8,8.01 v7.12,8.01
SPI_CIPO1/SDIO_DAT0  (via drill 0.2)
  Top 0.127: U3.15 6.5,18.71 6.2,19.01 v4.2,19.01
  Vert 0.127: v4.2,19.01 4.2,11.63 4.12,11.55 4.12,10.99 v4.3,10.81
  Bottom 0.127: J1.64 4.5,6.93 4.32,7.11 4.32,10.79 v4.3,10.81
SPI_CIPO/G4  (via drill 0.2)
  Top 0.127: J1.61 5.25,7.83 v4.96,8.11 | U3.31 9.2,11.55 8.64,10.99 7.68,10.99 7.6,10.91 7.6,10.61 7.66,10.55 v8.05,10.55
  Horz 0.127: v8.05,10.55 7.82,10.55 6.95,11.43 5.67,11.43 5.14,10.9 v5.14,10.61
  Vert 0.127: v5.14,10.61 5.14,8.29 v4.96,8.11
  Bottom 0.127: J1.48 8.5,7.41 8.89,7.8 8.89,8.32 7.98,9.23 7.07,9.23 6.99,9.31 6.99,9.5 7.1,9.61 8.08,9.61 8.18,9.71 8.18,10.01 8.08,10.11 7.1,10.11 6.99,10.22 6.99,10.61 7.08,10.71 7.91,10.71 v8.05,10.55
SPI_COPI1/SDIO_CMD  (via drill 0.2)
  Top 0.127: U3.18 5.26,17.51 v4.76,18.01
  Vert 0.127: v4.76,18.01 4.46,17.71 v4.46,11.41
  Bottom 0.127: v4.46,11.41 4.64,11.23 4.64,8.38 4.55,8.28 4.55,7.86 5.14,7.27 5.14,6.97 5,6.83 J1.62
SPI_COPI/G7  (via drill 0.2)
  Top 0.127: U3.35 10.8,11.18 9.03,9.41 7.8,9.41 v7.01,8.61 v7,8.61 | J1.69 3.25,6.22 3.15,6.32 3.15,8.06 3.58,8.49 4.76,8.49 4.79,8.53 5.14,8.53 5.36,8.31 v5.8,8.31 5.75,8.26 J1.59
  Horz 0.127: v5.8,8.31 6.1,8.61 v7,8.61
SPI_SCK1/SDIO_CLK  (via drill 0.2)
  Top 0.127: U3.17 v5.9,17.91
  Vert 0.127: v5.9,17.91 5.5,17.51 5.5,10.87 5.91,10.46 5.99,10.46 6.24,10.21 6.24,9.87 5.61,9.24 v5.61,8.81
  Bottom 0.127: J1.60 5.5,8.02 5.38,8.14 5.38,8.48 5.61,8.71 v5.61,8.81
SPI_SCK/G6
  Top 0.127: U3.34 10.4,11.21 8.9,9.71 7.08,9.71 6.99,9.62 6.3,9.62 | 6.3,9.62 3.98,9.62 3.8,9.44 3.8,9.01 3.6,8.81 3.47,8.81 2.75,8.09 J1.71 | J1.57 6.25,9.57 6.3,9.62
SWDCK  (via drill 0.2)
  Top 0.127: v15.3,10.51 15.25,10.46 15.25,9.91 14.99,9.65 14.99,9.37 15.25,9.11 J1.21 | v5.84,11.01 5.84,11.51 5.43,11.92 5.43,14.74 5.8,15.11 U3.24
  Horz 0.127: v15.3,10.51 12.4,10.51 12.03,10.14 7.71,10.14 6.78,11.06 5.89,11.06 v5.84,11.01
SWDIO  (via drill 0.2)
  Top 0.127: J1.23 14.75,10.1 v14.8,10.15 | U3.25 5.9,14.71 5.66,14.47 5.66,12.1 6.34,11.42 v6.34,10.62
  Horz 0.127: v14.8,10.15 12.37,10.15 12.12,9.91 7.55,9.91 6.84,10.62 v6.34,10.62
TX1  (via drill 0.2)
  Top 0.127: U3.2 v13.2,21.41 | J1.17 16.25,8.96 16.47,9.19 v16.47,9.69
  Horz 0.127: v16.5,21.61 15.18,21.61 14.84,21.27 14.56,21.27 14.42,21.41 v13.2,21.41
  Vert 0.127: v16.47,9.69 16.32,9.84 16.32,12.21 16.33,12.21 16.33,21.44 v16.5,21.61
USB_D+  (via drill 0.2)
  Top 0.127: J1.3 19.75,14.76 19,15.51 v19,17.21
  Bottom 0.127: v19,17.21 U2.3
USB_D-  (via drill 0.2)
  Top 0.127: J1.5 19.25,6.56 19.52,6.83 19.52,14.4 v19.21,14.71
  Bottom 0.127: U2.7 19.5,14.42 v19.21,14.71
USB_MUX_SIG
  Bottom 0.127: U2.1 18,17.61 R5.2 R18.2
USB_VIN  (via drill 0.2)
  Top 0.127: v21.2,18.11 21.1,18.01 18.6,18.01 18.16,17.57 18.16,13.91 18.16,9.25 18.36,9.05 18.36,8.77 18.13,8.54 18.13,6.45 18.25,6.34 J1.9
  Bottom 0.127: v21.2,18.11 R18.1
USBHOST_D+  (via drill 0.2)
  Top 0.127: J1.35 11.75,7.16 v11.24,7.67
  Horz 0.127: v18.5,13.77 17.4,12.67 13.84,12.67 12.6,13.91 v11.2,13.91
  Vert 0.127: v11.24,7.67 11.24,11.45 11.2,11.49 v11.2,13.91 | v18.57,17.4 18.57,13.84 v18.5,13.77
  Bottom 0.127: U2.2 18.5,17.33 v18.57,17.4
USBHOST_D-  (via drill 0.2)
  Top 0.127: J1.37 11.25,7.08 v11.24,7.09
  Horz 0.127: v10.75,14.01 10.86,13.9 10.86,13.77 11.06,13.57 12.62,13.57 13.75,12.44 17.5,12.44 18.48,13.43 18.64,13.43 18.92,13.71 19.4,13.71 19.6,13.51 19.6,12.91 19.4,12.71 v19,12.71
  Vert 0.127: v10.75,14.01 10.86,13.9 10.86,7.27 11.04,7.09 v11.24,7.09
  Bottom 0.127: v19,12.71 U2.8

### Text on the board
Bottom: v10
Dimension: Units in mm
tDocu: 0.8mm PCB / 45 degree chamfered edge / Four layer design | N. Seidle